# Altium schematic sheet main.SchDoc
size B; Organization: ORGANIZATION; Address1: ADDRESS 1; Address2: ADDRESS 2; Address3: ADDRESS 3; Address4: ADDRESS 4; Revision: -; SheetNumber: 1; SheetTotal: 2; ENG_APP_DATE: --/--/--; DSN_APP_DATE: --/--/--; CHK_APP_DATE: --/--/--
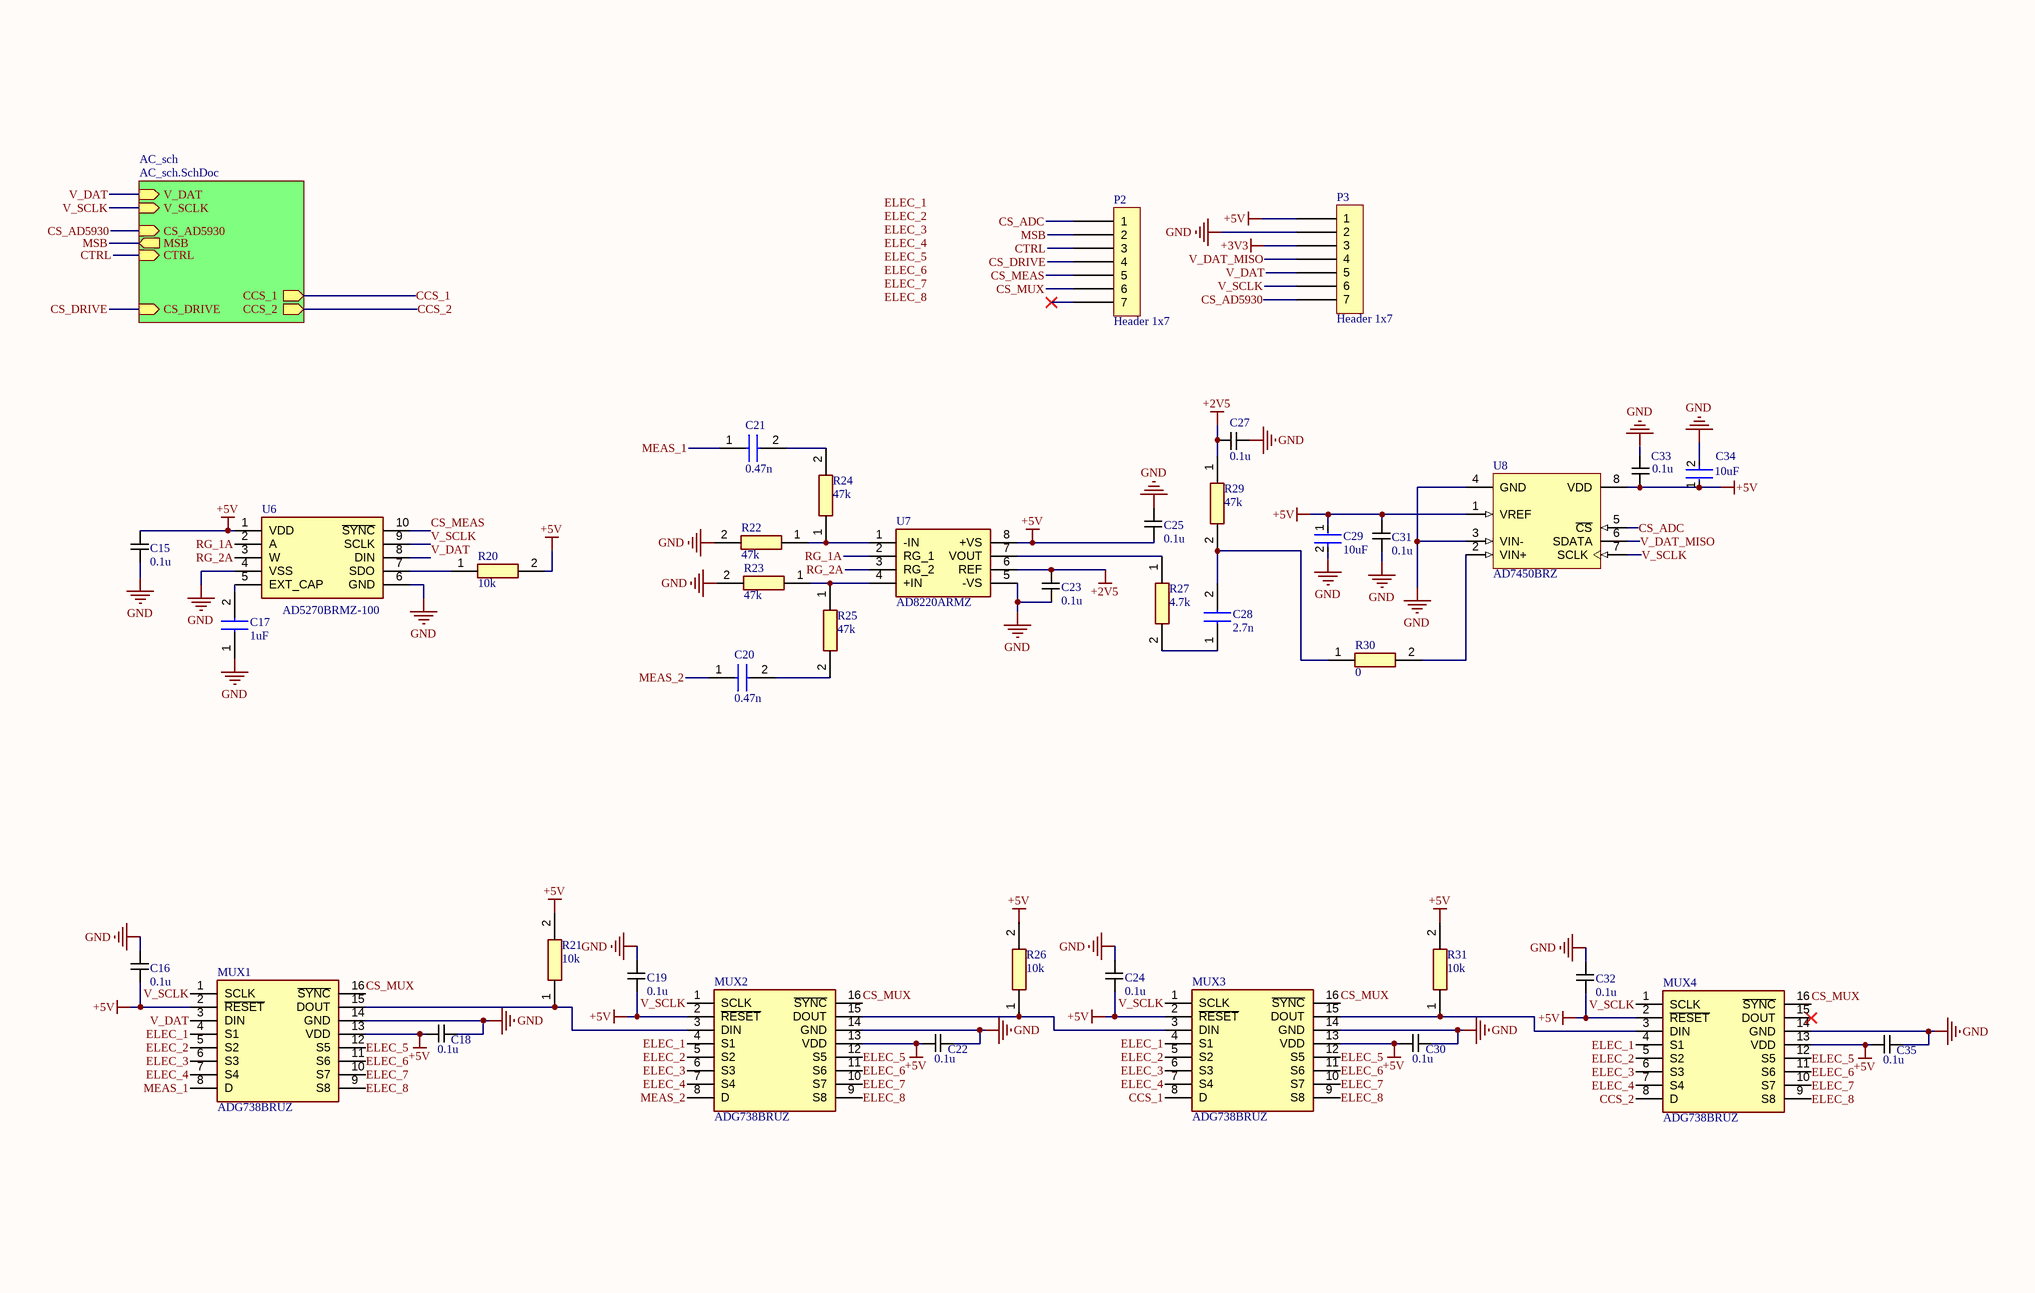
[diagram p0: main.SchDoc]

## Parts
C15  0.1u  [CAPC1005X55N]
C16  0.1u  [CAPC1005X55N]
C17  1uF  [CAPC1005X55N]
C18  0.1u  [CAPC1005X55N]
C19  0.1u  [CAPC1005X55N]
C20  0.47n  [CAPC1005X70N]
C21  0.47n  [CAPC1005X70N]
C22  0.1u  [CAPC1005X55N]
C23  0.1u  [CAPC1005X55N]
C24  0.1u  [CAPC1005X55N]
C25  0.1u  [CAPC1005X55N]
C27  0.1u  [CAPC1005X55N]
C28  2.7n  [CAPC1608X90N]
C29  10uF  [FP-0402-L_1_0_1-W_0_5_0_1-MFG]
C30  0.1u  [CAPC1005X55N]
C31  0.1u  [CAPC1005X55N]
C32  0.1u  [CAPC1005X55N]
C33  0.1u  [CAPC1005X55N]
C34  10uF  [FP-0402-L_1_0_1-W_0_5_0_1-MFG]
C35  0.1u  [CAPC1005X55N]
MUX1  ADG738BRUZ  [SOP65P640X120-16N]
MUX2  ADG738BRUZ  [SOP65P640X120-16N]
MUX3  ADG738BRUZ  [SOP65P640X120-16N]
MUX4  ADG738BRUZ  [SOP65P640X120-16N]
P2  Header 1x7  [Header 1x7 male]
P3  Header 1x7  [Header 1x7 male]
R20  10k  [RESC1005X40N]
R21  10k  [RESC1005X40N]
R22  47k  [RESC1608X55N]
R23  47k  [RESC1608X55N]
R24  47k  [RESC1608X55N]
R25  47k  [RESC1608X55N]
R26  10k  [RESC1005X40N]
R27  4.7k  [RESC1608X55N]
R29  47k  [RESC1608X55N]
R30  0  [RESC2012X65N]
R31  10k  [RESC1005X40N]
U6  AD5270BRMZ-100  [SOP50P490X110-10N]
U7  AD8220ARMZ  [SOP65P490X110-8N]
U8  AD7450BRZ  [R-8_N]

## Sub-sheets
AC_sch = AC_sch.SchDoc: MSB (out), CTRL (in), V_DAT (in), V_SCLK (in), CS_AD5930 (in), CCS_1 (out), CCS_2 (out), CS_DRIVE (in)

## Nets
+2V5: C23.1 C27.1 R29.1 U7.6(REF)
+3V3: P3.3
+5V: C15.1 C16.2 C18.2 C19.2 C22.2 C24.2 C25.2 C29.1 C30.2 C31.1 C32.2 C33.2 C34.1 C35.2 MUX1.2(~{RESET}) MUX1.13(VDD) MUX2.2(~{RESET}) MUX2.13(VDD) MUX3.2(~{RESET}) MUX3.13(VDD) MUX4.2(~{RESET}) MUX4.13(VDD) P3.1 R20.2 R21.2 R26.2 R31.2 U6.1(VDD) U7.8(+VS) U8.1(VREF) U8.8(VDD)
GND: C15.2 C16.1 C17.1 C18.1 C19.1 C22.1 C23.2 C24.1 C25.1 C27.2 C29.2 C30.1 C31.2 C32.1 C33.1 C34.2 C35.1 MUX1.14(GND) MUX2.14(GND) MUX3.14(GND) MUX4.14(GND) P3.2 R22.2 R23.2 U6.4(VSS) U6.6(GND) U7.5(-VS) U8.3(VIN-) U8.4(GND)
CCS_1: MUX3.8(D) ; sheet AC_sch/CCS_1
CCS_2: MUX4.8(D) ; sheet AC_sch/CCS_2
CS_AD5930: P3.7 ; sheet AC_sch/CS_AD5930
CS_ADC: P2.1 U8.5(~{CS})
CS_DRIVE: P2.4 ; sheet AC_sch/CS_DRIVE
CS_MEAS: P2.5 U6.10(~{SYNC})
CS_MUX: MUX1.16(~{SYNC}) MUX2.16(~{SYNC}) MUX3.16(~{SYNC}) MUX4.16(~{SYNC}) P2.6
CTRL: P2.3 ; sheet AC_sch/CTRL
ELEC_1: MUX1.4(S1) MUX2.4(S1) MUX3.4(S1) MUX4.4(S1)
ELEC_2: MUX1.5(S2) MUX2.5(S2) MUX3.5(S2) MUX4.5(S2)
ELEC_3: MUX1.6(S3) MUX2.6(S3) MUX3.6(S3) MUX4.6(S3)
ELEC_4: MUX1.7(S4) MUX2.7(S4) MUX3.7(S4) MUX4.7(S4)
ELEC_5: MUX1.12(S5) MUX2.12(S5) MUX3.12(S5) MUX4.12(S5)
ELEC_6: MUX1.11(S6) MUX2.11(S6) MUX3.11(S6) MUX4.11(S6)
ELEC_7: MUX1.10(S7) MUX2.10(S7) MUX3.10(S7) MUX4.10(S7)
ELEC_8: MUX1.9(S8) MUX2.9(S8) MUX3.9(S8) MUX4.9(S8)
MEAS_1: C21.1 MUX1.8(D)
MEAS_2: C20.1 MUX2.8(D)
MSB: P2.2 ; sheet AC_sch/MSB
RG_1A: U6.2(A) U7.2(RG_1)
RG_2A: U6.3(W) U7.3(RG_2)
V_DAT: MUX1.3(DIN) P3.5 U6.8(DIN) ; sheet AC_sch/V_DAT
V_DAT_MISO: P3.4 U8.6(SDATA)
V_SCLK: MUX1.1(SCLK) MUX2.1(SCLK) MUX3.1(SCLK) MUX4.1(SCLK) P3.6 U6.9(SCLK) U8.7(SCLK) ; sheet AC_sch/V_SCLK
NetC17_2: C17.2 U6.5(EXT_CAP)
NetC20_2: C20.2 R25.2
NetC21_2: C21.2 R24.2
NetC28_1: C28.1 R27.2
NetC28_2: C28.2 R29.2 R30.1
NetMUX1_15: MUX1.15(DOUT) MUX2.3(DIN) R21.1
NetMUX2_15: MUX2.15(DOUT) MUX3.3(DIN) R26.1
NetMUX3_15: MUX3.15(DOUT) MUX4.3(DIN) R31.1
NetR20_1: R20.1 U6.7(SDO)
NetR22_1: R22.1 R24.1 U7.1(-IN)
NetR23_1: R23.1 R25.1 U7.4(+IN)
NetR27_1: R27.1 U7.7(VOUT)
NetR30_2: R30.2 U8.2(VIN+)

Not connected (* = marked no-connect by the designer): MUX4 15(DOUT)*; P2 7*

## Notes on the sheet
- Labels drawn without touching a wire or pin: ELEC_1, ELEC_2, ELEC_3, ELEC_4, ELEC_5, ELEC_6, ELEC_7, ELEC_8
- DWG. NO.
- REV.
- SHT.
- THIS DOCUMENT AND THE DATA DISCLOSED HEREIN OR HEREWITH IS THE PROPERTY OF ALTIUM LIMITED AND MAY BE FREELY DISTRIBUTED IN WHOLE. NO RIGHTS ARE RESERVED OR EXPRESS OR IMPLIED WARANTEE GIVEN.
- REVISION
- DESCRIPTION
- DATE
- APPROVED
- ENG:
- APPROVALS
- PROJECT
- DSN:
- CHK:
- REFERENCE DOCUMENTS
- PROJECT REVISION:
- TITLE
- DOCUMENT REVISION:
- DESIGN ITEM:
- BOM:
- FAB DWG:
- PCB DWG:
- ASSY DWG:
- SCALE:
- SIZE
- B
- CAGE CODE
- FILE NAME
- DWG NO.
- SHEET
- OF
- REV

## Library data of the parts
C15 C16 C18 C19 C22-C25 C27 C30-C33 C35 = CL05B104KO5NNNC: Capacitor; Manufacturer_Name: SAMSUNG; Datasheet Link: https://datasheet.datasheetarchive.com/originals/distributors/Datasheets-DGA10/2408147.pdf; Height: 0.55mm; Manufacturer_Part_Number: CL05B104KO5NNNC; Mouser Part Number: 187-CL05B104KO5NNNC; Mouser Price/Stock: https://www.mouser.co.uk/ProductDetail/Samsung-Electro-Mechanics/CL05B104KO5NNNC?qs=hqM3L16%252BxlfT2SKOuAUq6Q%3D%3D; Arrow Part Number: CL05B104KO5NNNC; Arrow Price/Stock: https://www.arrow.com/en/products/cl05b104ko5nnnc/samsung-electro-mechanics?utm_currency=USD&region=nac
C17 = CL05A105KP5NNNC: Capacitor; Manufacturer_Name: SAMSUNG; Datasheet Link: https://www.arrow.com/en/products/cl05a105kp5nnnc/samsung-electro-mechanics; Height: 0.55mm; Manufacturer_Part_Number: CL05A105KP5NNNC; Mouser Part Number: 187-CL05A105KP5NNNC; Mouser Price/Stock: https://www.mouser.co.uk/ProductDetail/Samsung-Electro-Mechanics/CL05A105KP5NNNC?qs=X6jEic%2FHinBsUeNeR9HD7w%3D%3D; Arrow Part Number: CL05A105KP5NNNC; Arrow Price/Stock: https://www.arrow.com/en/products/cl05a105kp5nnnc/samsung-electro-mechanics?region=nac
C20 C21 = GRM1555C1H431JA01D: Capacitor; Manufacturer_Name: Murata Electronics; Datasheet Link: https://search.murata.co.jp/Ceramy/image/img/A01X/G101/ENG/GRM1555C1H431JA01-01A.pdf; Height: 0.7mm; Manufacturer_Part_Number: GRM1555C1H431JA01D; Mouser Part Number: 81-GRM1555C1H431JA1D; Mouser Price/Stock: https://www.mouser.co.uk/ProductDetail/Murata-Electronics/GRM1555C1H431JA01D?qs=MY6wChARw2wtFsv3uU537Q%3D%3D
C28 = GRM1885C1H272JA01D: Capacitor; Manufacturer_Name: Murata Electronics; Datasheet Link: https://search.murata.co.jp/Ceramy/image/img/A01X/G101/ENG/GRM1885C1H272JA01-01A.pdf; Height: 0.9mm; Manufacturer_Part_Number: GRM1885C1H272JA01D; Mouser Part Number: 81-GRM185C1H272JA01D; Mouser Price/Stock: https://www.mouser.co.uk/ProductDetail/Murata-Electronics/GRM1885C1H272JA01D?qs=%2FEhSLMV8HUQlL5ZggNQk6g%3D%3D; Arrow Part Number: GRM1885C1H272JA01D; Arrow Price/Stock: https://www.arrow.com/en/products/grm1885c1h272ja01d/murata-manufacturing
C29 C34 = CMP-04427-000034-1: CAP CER 10UF 4V X5R 0402; RoHS Compliant: Yes
MUX1-MUX4 = ADG738BRUZ: Integrated Circuit; Manufacturer_Name: Analog Devices; Datasheet Link: http://www.analog.com/media/en/technical-documentation/data-sheets/ADG738_739.pdf; Height: 1.2mm; Manufacturer_Part_Number: ADG738BRUZ; Mouser Part Number: 584-ADG738BRUZ; Mouser Price/Stock: https://www.mouser.co.uk/ProductDetail/Analog-Devices/ADG738BRUZ?qs=BpaRKvA4VqFBoYY1IG1vMw%3D%3D; Arrow Part Number: ADG738BRUZ; Arrow Price/Stock: https://www.arrow.com/en/products/adg738bruz/analog-devices
R20 R21 R26 R31 = RC0402JR-0710KL: Resistor; Manufacturer_Name: YAGEO; Datasheet Link: https://www.yageo.com/upload/media/product/productsearch/datasheet/rchip/PYu-RC_Group_51_RoHS_L_12.pdf; Height: 0.4mm; Manufacturer_Part_Number: RC0402JR-0710KL; Mouser Part Number: 603-RC0402JR-0710KL; Mouser Price/Stock: https://www.mouser.co.uk/ProductDetail/YAGEO/RC0402JR-0710KL?qs=V1yeUXFNrkk4BhFptVo0Rw%3D%3D; Arrow Part Number: RC0402JR-0710KL; Arrow Price/Stock: https://www.arrow.com/en/products/rc0402jr-0710kl/yageo?region=nac
R22-R25 R29 = 0603WAF4702T5E: Resistor; Manufacturer_Name: UNI-ROYAL(Uniroyal Elec); Datasheet Link: https://datasheet.lcsc.com/szlcsc/Uniroyal-Elec-0603WAF4702T5E_C25819.pdf; Height: 0.55mm; Manufacturer_Part_Number: 0603WAF4702T5E
R27 = 0603WAF4701T5E: Resistor; Manufacturer_Name: UNI-ROYAL(Uniroyal Elec); Datasheet Link: https://datasheet.lcsc.com/szlcsc/Uniroyal-Elec-0603WAF4701T5E_C23162.pdf; Height: 0.55mm; Manufacturer_Part_Number: 0603WAF4701T5E
R30 = CPF0805B10RE1: Resistor; Manufacturer_Name: TE Connectivity; Datasheet Link: http://docs-europe.electrocomponents.com/webdocs/13d1/0900766b813d116f.pdf; Height: 0.65mm; Manufacturer_Part_Number: CPF0805B10RE1; Mouser Part Number: 279-CPF0805B10RE1; Mouser Price/Stock: https://www.mouser.co.uk/ProductDetail/TE-Connectivity-Holsworthy/CPF0805B10RE1?qs=qj6TO2nKJqjxTen6wABuaQ%3D%3D; Arrow Part Number: CPF0805B10RE1; Arrow Price/Stock: https://www.arrow.com/en/products/cpf0805b10re1/te-connectivity?region=nac
U6 = AD5270BRMZ-100: Integrated Circuit; Manufacturer_Name: Analog Devices; Datasheet Link: https://www.analog.com/media/en/technical-documentation/data-sheets/ad5270_5271.pdf; Height: 1.1mm; Manufacturer_Part_Number: AD5270BRMZ-100; Mouser Part Number: 584-AD5270BRMZ-100; Mouser Price/Stock: https://www.mouser.co.uk/ProductDetail/Analog-Devices/AD5270BRMZ-100?qs=NmRFExCfTkFpgTn7ufWp4w%3D%3D; Arrow Part Number: AD5270BRMZ-100; Arrow Price/Stock: https://www.arrow.com/en/products/ad5270brmz-100/analog-devices?region=europe
U7 = AD8220ARMZ: Integrated Circuit; Manufacturer_Name: Analog Devices; Datasheet Link: http://www.analog.com/static/imported-files/data_sheets/AD8220.pdf; Height: 1.1mm; Manufacturer_Part_Number: AD8220ARMZ; Mouser Part Number: 584-AD8220ARMZ; Mouser Price/Stock: https://www.mouser.co.uk/ProductDetail/Analog-Devices/AD8220ARMZ?qs=%2FtpEQrCGXCySRYIeTivM6A%3D%3D; Arrow Part Number: AD8220ARMZ; Arrow Price/Stock: https://www.arrow.com/en/products/ad8220armz/analog-devices?utm_currency=USD&region=europe
U8 = CMP-0313-01330-2: Single 12-Bit Analog-to-Digital Converter with Serial Interface, 1MSPS, -40 to +85 degC, R-8, Pb-Free, Tube; Manufacturer: Analog Devices; Generic Part Number: AD7450; Resolution (Bits): 12; Interface: Ser; Channels: 1; Throughput Rate (SPS): 1M; PackageReference: R-8; ComponentLink4URL: http://www.analog.com/en/analog-to-digital-converters/ad-converters/ad7450/products/product.html; ComponentLink2URL: http://www.analog.com/static/imported-files/data_sheets/AD7450.pdf; Mounting Technology: Surface Mount; DatasheetVersion: Rev.A; Code_JEDEC: MS-012-AA; PartNumber: AD7450BRZ; ComponentLink3URL: http://www.analog.com/static/imported-files/packages/PKG_PDF/SOIC_Narrow%20(R)/R_8.pdf; Packing: Tube; PackageDescription: 8-Lead Standard Small Outline Package [SOIC_N] Narrow Body; ComponentLink2Description: Datasheet; ComponentLink1URL: http://www.analog.com/en/index.html; ComponentLink3Description: Package Specification; ComponentLink1Description: Manufacturer URL; Code_IPC: SOIC127P600-8; PackageVersion: 060506-A; ComponentLink4Description: Product URL; RoHS: Y